# EasyEDA Pro project ProPrj_H750VBT6M2_2025-05-30.epro, schematic Croe
Board Name: Board1; Create Date: 2025-05-16; Page Name: P1; Project Name: H750VBT6M2; Schematic Name: Croe; Update Date: 2025-05-23; Company: 嘉立创EDA; Page Size: A4; Version: V1.0
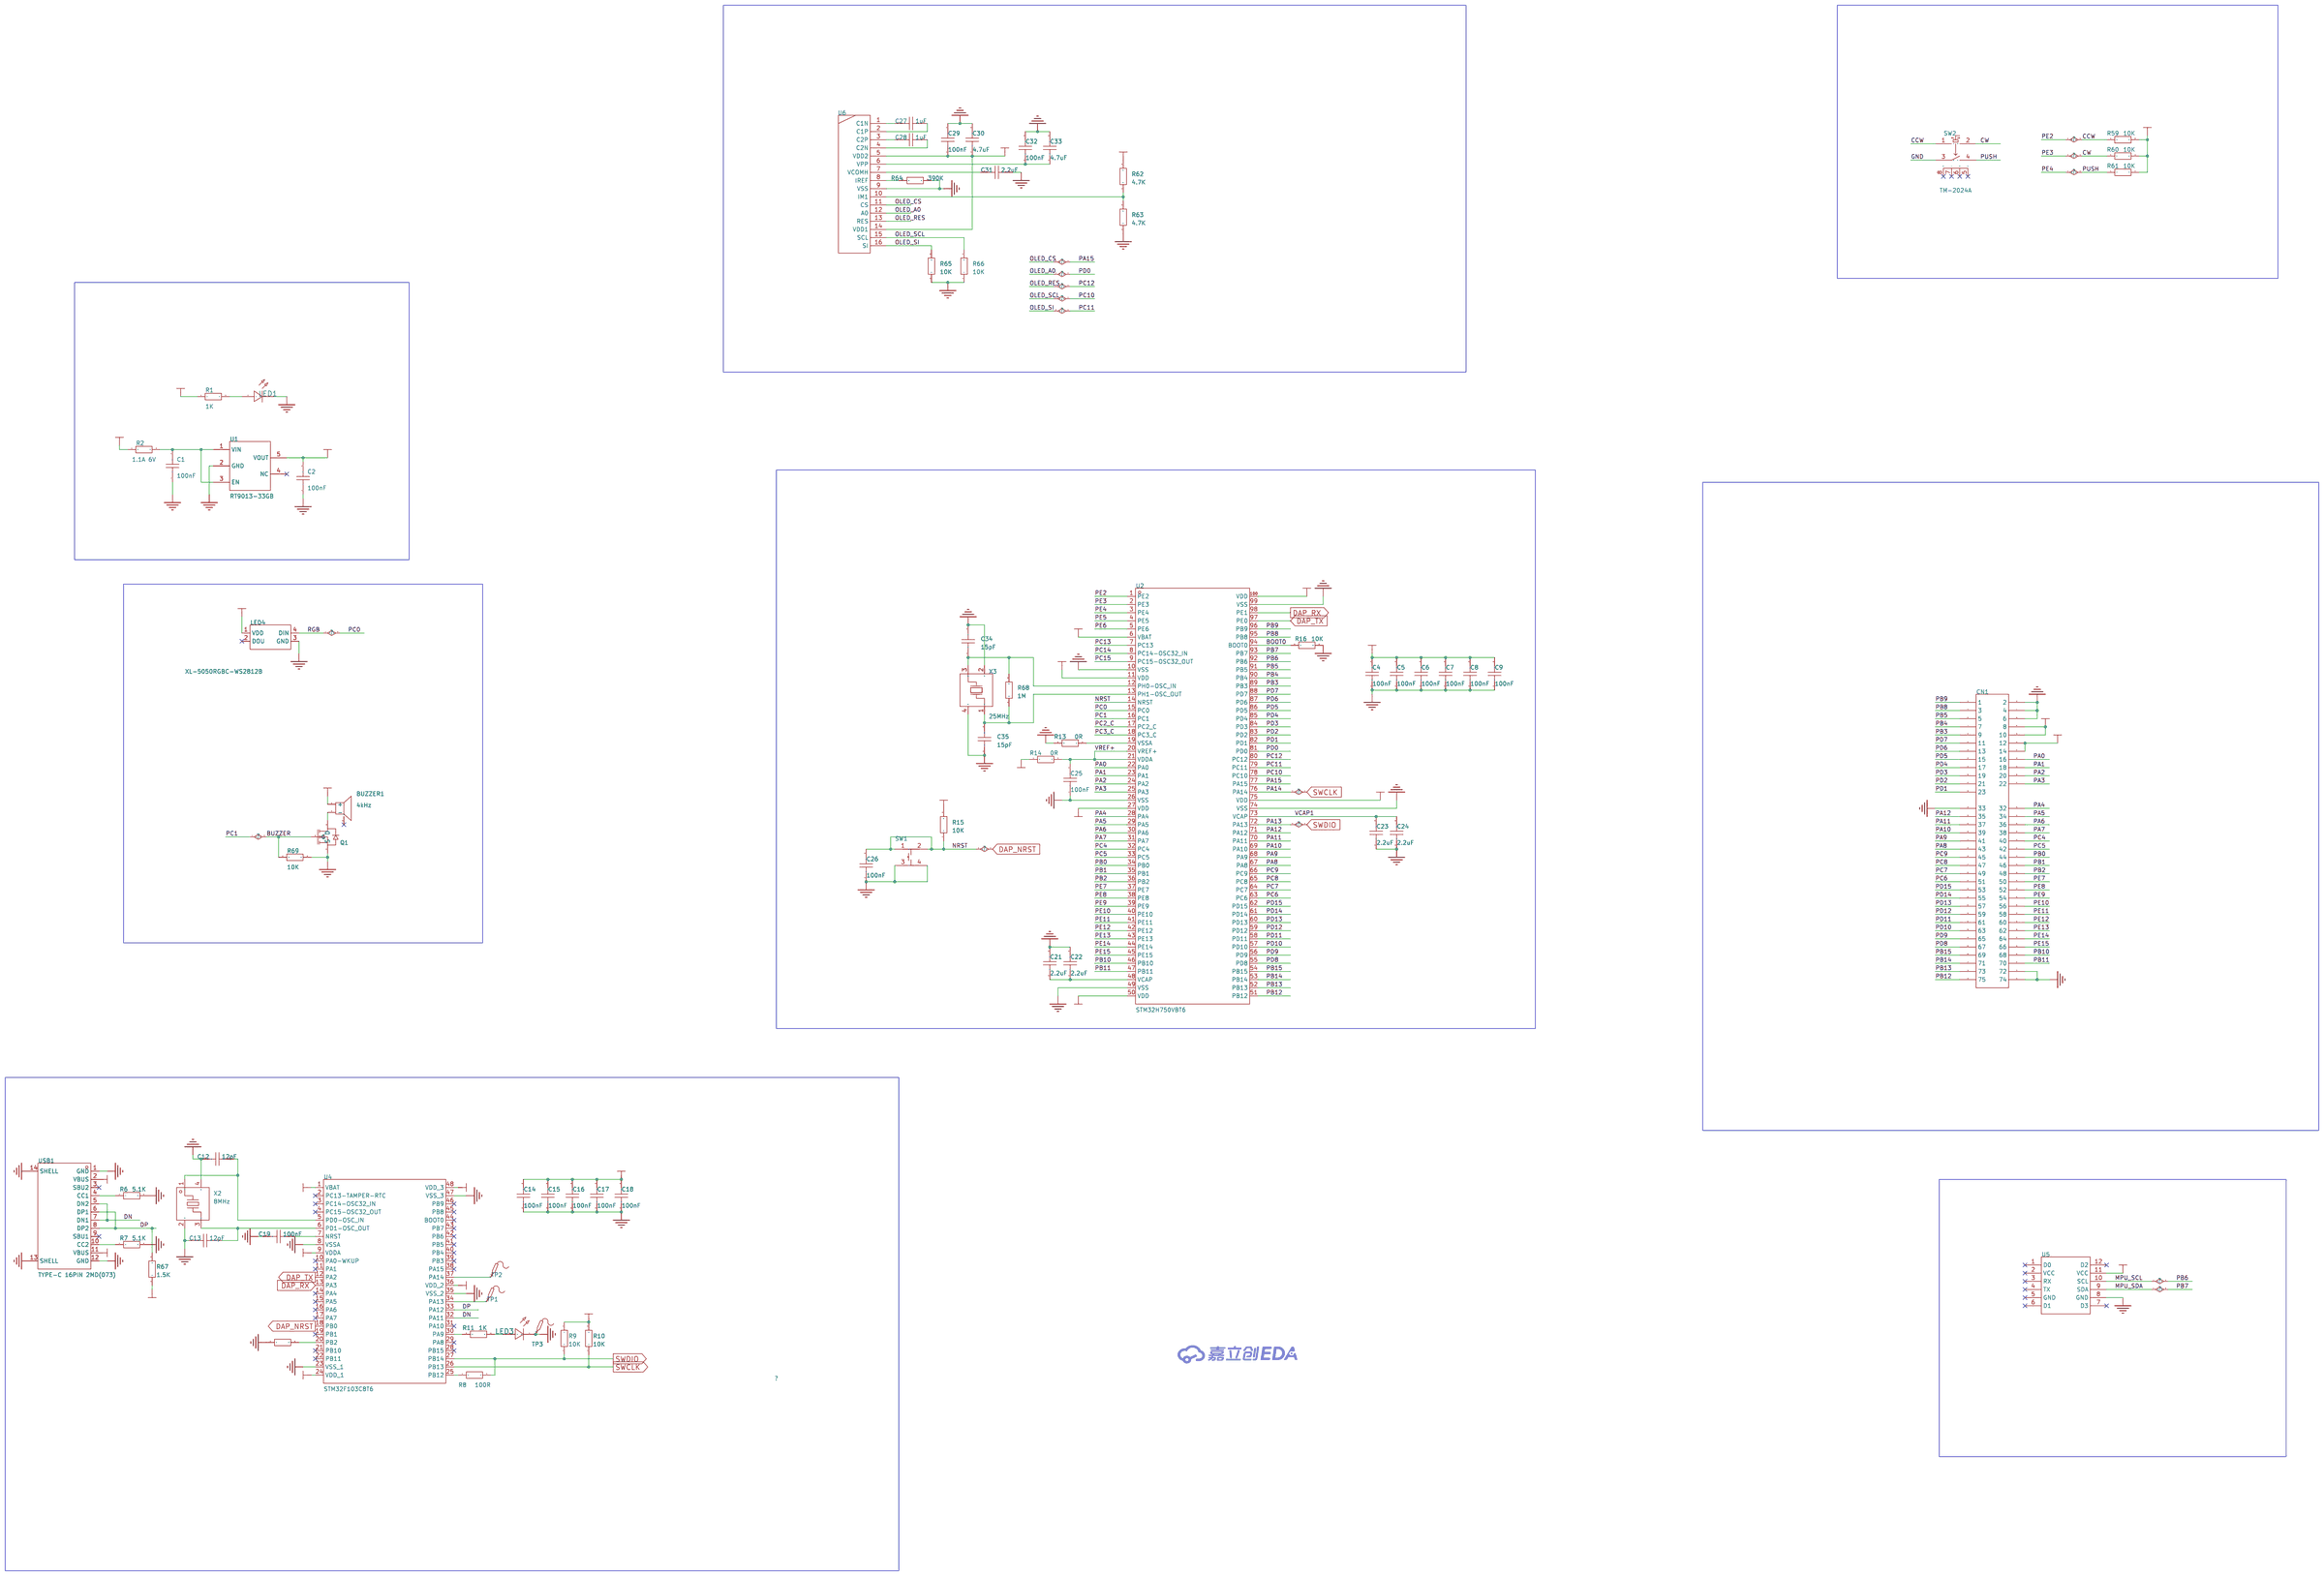
[diagram p1: schematic sheet]

## Parts
BUZZER1  4kHz  [BUZ-SMD_L5.0-W5.5-P4.60]
C1  100nF  [C0603]
C2  100nF  [C0603]
C4  100nF  [C0603]
C5  100nF  [C0603]
C6  100nF  [C0603]
C7  100nF  [C0603]
C8  100nF  [C0603]
C9  100nF  [C0603]
C12  12pF  [C0603]
C13  12pF  [C0603]
C14  100nF  [C0603]
C15  100nF  [C0603]
C16  100nF  [C0603]
C17  100nF  [C0603]
C18  100nF  [C0603]
C19  100nF  [C0603]
C21  2.2uF  [C0603]
C22  2.2uF  [C0603]
C23  2.2uF  [C0603]
C24  2.2uF  [C0603]
C25  100nF  [C0603]
C26  100nF  [C0603]
C27  1uF  [C0603]
C28  1uF  [C0603]
C29  100nF  [C0603]
C30  4.7uF  [C0603]
C31  2.2uF  [C0603]
C32  100nF  [C0603]
C33  4.7uF  [C0603]
C34  15pF  [C0603]
C35  15pF  [C0603]
CN1  M.2-E Key GF  [NGFF-M.2-75P-0.5mmE KEYGF]
LED1  -  [LED_0603]
LED3  -  [LED_0603]
LED4  XL-5050RGBC-WS2812B  [LED-SMD_4P-L5.0-W5.0-BL_XL-5050RGBC]
Q1  -  [SOT-23-3_L2.9-W1.3-P1.90-LS2.4-BR]
R1  1K  [R0603]
R2  1.1A 6V  [R1206]
R6  5.1K  [R0603]
R7  5.1K  [R0603]
R8  100R  [R0603]
R9  10K  [R0603]
R10  10K  [R0603]
R11  1K  [R0603]
R12  10K  [R0603]
R13  0R  [R0603]
R14  0R  [R0603]
R15  10K  [R0603]
R16  10K  [R0603]
R59  10K  [R0603]
R60  10K  [R0603]
R61  10K  [R0603]
R62  4.7K  [R0603]
R63  4.7K  [R0603]
R64  390K  [R0603]
R65  10K  [R0603]
R66  10K  [R0603]
R67  1.5K  [R0603]
R68  1M  [R0603]
R69  10K  [R0603]
SW1  TS3425BA  [SW-SMD_4P-L4.2-W3.2-P2.15-LS4.6-1]
SW2  TM-2024A  [SW-SMD_TM-2024A]
TP1  -  [Test-Point-0.5mm]
TP2  -  [Test-Point-0.5mm]
TP3  -  [Test-Point-0.5mm]
U1  RT9013-33GB  [SOT-23-5_L3.0-W1.7-P0.95-LS2.8-BL]
U2  STM32H750VBT6  [LQFP-100_L14.0-W14.0-P0.50-LS16.0-BL]
U4  STM32F103C8T6  [LQFP-48_L7.0-W7.0-P0.50-LS9.0-BL]
U5  -  [JY901S]
U6  -  [1.29oled_spi_焊接_ch1115]
USB1  TYPE-C 16PIN 2MD(073)  [USB-C-SMD_TYPE-C-6PIN-2MD-073]
X2  8MHz  [CRYSTAL-SMD_4P-L3.2-W2.5-BL]
X3  25MHz  [CRYSTAL-SMD_4P-L3.2-W2.5-BL]

## Library data of the parts
BUZZER1 = MLT-5020: 驱动方式:无源(外部驱动);构造类型:电磁式;频率:4kHz;; Supplier Part: C94598; Manufacturer: 华能; Supplier Footprint: SMD,5x5mm; JLCPCB Part Class: 扩展库; Datasheet: https://atta.szlcsc.com/upload/public/pdf/source/20210811/111454390007D221D7259018FB170E62.pdf; Supplier: LCSC; Driver Circuitry: 无源(外部驱动); Technology: 电磁式; Length: 5.2mm; Width: 5.2mm; Height: 2.5mm
C1 C2 C4-C9 C12-C19 C21-C35 = CAP_0603: Supplier Footprint: 0603
CN1 = M.2-E Key GF: Standardization Check: false; Check: false
LED1 LED3 = LED_0603-R: Supplier Footprint: 0603
LED4 = XL-5050RGBC-WS2812B: 5050七彩幻彩透明贴片LED灯珠 5050 幻彩透明四脚 ws2812B 内置驱动IC; Supplier Part: C2843785; Manufacturer: XINGLIGHT(成兴光); Supplier Footprint: SMD5050; JLCPCB Part Class: 扩展库; Datasheet: https://atta.szlcsc.com/upload/public/pdf/source/20240412/E1004CAA80592E31D08BFE019083806F.pdf; Supplier: LCSC
Q1 = AO3400A_N: 类型:N沟道;漏源电压(Vdss):30V;连续漏极电流(Id):5.2A;功率(Pd):1W;导通电阻(RDS(on)@Vgs,Id):35mΩ@10V,5A;阈值电压(Vgs(th)@Id):1.5V@250μA;; Supplier Footprint: SOT-23; Supplier Part: C700953
R1 R6-R16 R59-R69 = Res_0603: Supplier Footprint: 0603
R2 = Res_1206: Supplier Footprint: 1206
SW1 = TS3425BA: 电路结构:单刀单掷;按钮形状:椭圆形按钮;作用力:250gf;安装方式:立贴;开关长度:4.2mm;开关宽度:3.2mm;开关高度:2.5mm;带支架:不带;触点电流:50mA;额定电压(DC):12V;绝缘电阻:100MΩ;机械寿命:10万次;; LCSC Part Name: 4.2*3.2*2.5mm 立贴 轻触开关; Supplier Part: C2681476; Manufacturer: SHOU HAN(首韩); Supplier Footprint: SMD; JLCPCB Part Class: 扩展库; Datasheet: https://atta.szlcsc.com/upload/public/pdf/source/20210107/C2681476_BF217B2301F0070AA49504CB0BFDE895.pdf; Supplier: LCSC; Circuit: 单刀单掷; Actuator Style: 椭圆形按钮; Operating Force: 250gf; Mounting Style: 立贴; Switch Length: 4.2mm; Switch Width: 3.2mm; Switch Height: 2.5mm; Strike Gundam: 不带; Contact Current: 50mA; Voltage Rating (DC): 12V; Insulation Resistance: 100MΩ; Actuator/Cap Color: 白色; Pin Style: J型引脚; Mechanical Life: 10万次; Operating Temperature: -20℃~+85℃
SW2 = TM-2024A: LCSC Part Name: 四脚两档拨轮开关TM-2024A; Supplier Part: C561480; Manufacturer: XKB Connection(中国星坤); Supplier Footprint: SMD; JLCPCB Part Class: 扩展库; Datasheet: https://atta.szlcsc.com/upload/public/pdf/source/20211011/7A4DB3DC37E7D5823B6D92C66ED3191E.pdf; Supplier: LCSC
TP1-TP3 = Test-Point: Test Point 测试点
U1 = RT9013-33GB: 输出类型:固定;最大输入电压:5.5V;输出电压:3.3V;输出电流:500mA;电源纹波抑制比(PSRR):50dB@(10kHz);输出极性:正极;; LCSC Part Name: 输入5.5V 输出3.3V 500mA; Supplier Part: C47773; Manufacturer: RICHTEK(立锜); Supplier Footprint: SOT-23-5; JLCPCB Part Class: 扩展库; Datasheet: https://atta.szlcsc.com/upload/public/pdf/source/20150504/1457707282459.pdf; Supplier: LCSC; Output Type: 固定; Maximum Input Voltage: 5.5V; Output Voltage: 3.3V; Output Current: 500mA; Power Supply Rejection Ratio (PSRR): 50dB@(10kHz); Dropout Voltage: 400mV@(500mA); standby current: 50uA; Feature: 低ESR；防静电保护；热保护(TSD)；过流保护(OCP)；带使能; Operating Temperature: -40℃~+85℃; Output Polarity: 正极; Number of Outputs: 1
U2 = STM32H750VBT6: CPU内核:ARM-M系列;CPU最大主频:480MHz;应用领域:-;; LCSC Part Name: 带DSP和DP-FPU的高性能ARM Cortex-M7 MCU，具有128 KB Flash、1 MB RAM、480 MHz CPU、一级缓存、外部存储器接口、JPEG编解码器、硬件加密和大量外设; Supplier Part: C404010; Manufacturer: ST(意法半导体); Supplier Footprint: LQFP-100(14x14); JLCPCB Part Class: 扩展库; Datasheet: https://atta.szlcsc.com/upload/public/pdf/source/20231008/912982D4F3BD3DF1AA7D0A7EE6EF5B6B.pdf; Supplier: LCSC; CPU Core: ARM-M系列; CPU Maximum Speed: 480MHz; Program Storage Size: 128KB; Program Memory Type: FLASH; Number of I/O: 82; ADC (Bit): 16bit; DAC (Bit): 12bit; Voltage - Supply: 1.62V~3.6V
U4 = STM32F103C8T6: CPU内核:ARM-M3;程序存储容量:64KB;RAM总容量:20KB;GPIO端口数量:37;工作电压范围:2V~3.6V;CPU最大主频:72MHz;程序存储器类型:FLASH;; Supplier Part: C8734; Manufacturer: ST(意法半导体); Supplier Footprint: LQFP-48(7x7); JLCPCB Part Class: 扩展库; Datasheet: https://atta.szlcsc.com/upload/public/pdf/source/20220812/8363ACEC51AD55ECEB84799464F7CB85.pdf; Supplier: LCSC; CPU Core: ARM-M3; Program Storage Size: 64KB; RAM Size: 20KB; GPIO Ports Number: 37; Operating Voltage Range: 2V~3.6V; CPU Maximum Speed: 72MHz; Program Memory Type: FLASH; Operating Temperature Range: -40℃~+85℃; ADC (Bit): 12bit; Universal Serial Bus: 有; Peripheral/Function: 看门狗；DMA；看门狗；温度传感器; Watchdog: 有; Infrared Data Association: 有; Low-Voltage Detect: 有; Direct Memory Access: 有; Internal Oscillator: 有
U5 = JY901S
U6 = 1.29oled_spi_焊接_ch1115
USB1 = TYPE-C 16PIN 2MD(073): 连接器类型:Type-C;标准:USB 3.1;公母:母;安装方式:卧贴;触点数量:16P;端口数量:1;额定电流 - 电源:5A;工作温度范围:-25℃~+85℃;; LCSC Part Name: Type-C 母 卧贴; Supplier Part: C2765186; Manufacturer: SHOU HAN(首韩); Supplier Footprint: SMD; JLCPCB Part Class: 扩展库; Datasheet: https://atta.szlcsc.com/upload/public/pdf/source/20211123/39B17C16241EAC15C5E277BDA434118E.pdf; Supplier: LCSC; Connector Type: Type-C; Standard: USB 3.1; Gender: 母; Mounting Style: 卧贴; Number of Contacts: 16P; Number of Ports: 1; Current Rating - Power (Max): 5A; Operating Temperature Range: -25℃~+85℃; Rated Voltage (Max): 5V; Connect-Disconnect Life: 5千次; Core Colour: 黑色
X2 = X32258MSB4SI: 晶振类型:贴片晶振;频率:8MHz;常温频差:±10ppm;负载电容:20pF;频率稳定度:±20ppm;; LCSC Part Name: 8MHz ±10ppm 20pF; Supplier Part: C2682774; Manufacturer: YXC(扬兴晶振); Supplier Footprint: SMD3225-4P; JLCPCB Part Class: 扩展库; Datasheet: https://atta.szlcsc.com/upload/public/pdf/source/20240329/19D5F850207469550BEB00D7DFEDBC7A.pdf; Supplier: LCSC; Type: 贴片晶振; Normal temperature Frequency Tolerance: ±10ppm; Load Capacitance: 20pF; Frequency Stability: ±20ppm; Operating Temperature: -40℃~+85℃
X3 = X322525MOB4SI: 晶振类型:贴片晶振;频率:25MHz;常温频差:±10ppm;负载电容:12pF;频率稳定度:±20ppm;; LCSC Part Name: 25MHz ±10ppm 12pF; Supplier Part: C9006; Manufacturer: YXC(扬兴晶振); Supplier Footprint: SMD3225-4P; JLCPCB Part Class: 基础库; Datasheet: https://atta.szlcsc.com/upload/public/pdf/source/20240329/19D5F850207469550BEB00D7DFEDBC7A.pdf; Supplier: LCSC; Type: 贴片晶振; Normal temperature Frequency Tolerance: ±10ppm; Load Capacitance: 12pF; Frequency Stability: ±20ppm; Operating Temperature: -40℃~+85℃

## Nets
3V3: BUZZER1.1(+) C2.2 C4.2 C5.2 C6.2 C7.2 C8.2 C9.2 C14.2 C15.2 C16.2 C17.2 C18.2 C29.1 C30.1 CN1.12 CN1.14 LED4.1(VDD) R1.1 R9.2 R10.2 R14.1 R15.2 R59.2 R60.2 R61.2 R62.2 R67.1 U1.5(VOUT) U2.6(VBAT) U2.11(VDD) U2.27(VDD) U2.50(VDD) U2.75(VDD) U2.100(VDD) U4.1(VBAT) U4.9(VDDA) U4.24(VDD_1) U4.36(VDD_2) U4.48(VDD_3) U5.11(VCC) U6.5(VDD2) U6.14(VDD1)
5V: CN1.8 CN1.10 R2.1 USB1.2(VBUS) USB1.11(VBUS)
GND: C1.1 C2.1 C4.1 C5.1 C6.1 C7.1 C8.1 C9.1 C12.2 C13.1 C14.1 C15.1 C16.1 C17.1 C18.1 C19.1 C21.2 C22.2 C23.1 C24.1 C25.1 C26.1 C29.2 C30.2 C31.2 C32.2 C33.2 C34.2 C35.1 CN1.2 CN1.4 CN1.6 CN1.33 CN1.72 CN1.74 LED1.1(C) LED3.1(C) LED4.3(GND) Q1.2(S) R6.2 R7.2 R12.1 R13.1 R16.2 R63.1 R64.2 R65.1 R66.1 R69.2 SW1.3 SW1.4 SW2.3 TP3.1 U1.2(GND) U2.10(VSS) U2.26(VSS) U2.49(VSS) U2.74(VSS) U2.99(VSS) U4.8(VSSA) U4.23(VSS_1) U4.35(VSS_2) U4.47(VSS_3) U5.8(GND) U6.9(VSS) USB1.1(GND) USB1.12(GND) USB1.13(SHELL) USB1.14(SHELL) X2.2(GND) X2.4(GND) X3.2(GND) X3.4(GND)
BOOT0: R16.1 U2.94(BOOT0)
BUZZER: Q1.1(G) R69.1 U2.16(PC1)
CCW: R59.1 SW2.1 U2.1(PE2)
CW: R60.1 SW2.2 U2.2(PE3)
DAP_NRST: C26.2 R15.1 SW1.1 SW1.2 U2.14(NRST) U4.18(PB0)
DAP_RX: U2.98(PE1) U4.13(PA3)
DAP_TX: U2.97(PE0) U4.12(PA2)
DN: U4.32(PA11) USB1.5(DN2) USB1.7(DN1)
DP: R67.2 U4.33(PA12) USB1.6(DP1) USB1.8(DP2)
MPU_SCL: U2.92(PB6) U5.10(SCL)
MPU_SDA: U2.93(PB7) U5.9(SDA)
OLED_A0: U2.81(PD0) U6.12(A0)
OLED_CS: U2.77(PA15) U6.11(CS)
OLED_RES: U2.80(PC12) U6.13(RES)
OLED_SCL: R66.2 U2.78(PC10) U6.15(SCL)
OLED_SI: R65.2 U2.79(PC11) U6.16(SI)
PA0: CN1.16 U2.22(PA0)
PA1: CN1.18 U2.23(PA1)
PA2: CN1.20 U2.24(PA2)
PA3: CN1.22 U2.25(PA3)
PA4: CN1.32 U2.28(PA4)
PA5: CN1.34 U2.29(PA5)
PA6: CN1.36 U2.30(PA6)
PA7: CN1.38 U2.31(PA7)
PA8: CN1.43 U2.67(PA8)
PA9: CN1.41 U2.68(PA9)
PA10: CN1.39 U2.69(PA10)
PA11: CN1.37 U2.70(PA11)
PA12: CN1.35 U2.71(PA12)
PA13: R8.2 R9.1 U2.72(PA13) U4.27(PB14)
PA14: R10.1 U2.76(PA14) U4.26(PB13)
PB0: CN1.44 U2.34(PB0)
PB1: CN1.46 U2.35(PB1)
PB2: CN1.48 U2.36(PB2)
PB3: CN1.9 U2.89(PB3)
PB4: CN1.7 U2.90(PB4)
PB5: CN1.5 U2.91(PB5)
PB8: CN1.3 U2.95(PB8)
PB9: CN1.1 U2.96(PB9)
PB10: CN1.68 U2.46(PB10)
PB11: CN1.70 U2.47(PB11)
PB12: CN1.75 U2.51(PB12)
PB13: CN1.73 U2.52(PB13)
PB14: CN1.71 U2.53(PB14)
PB15: CN1.69 U2.54(PB15)
PC0: LED4.4(DIN) U2.15(PC0)
PC2_C: U2.17(PC2_C)
PC3_C: U2.18(PC3_C)
PC4: CN1.40 U2.32(PC4)
PC5: CN1.42 U2.33(PC5)
PC6: CN1.51 U2.63(PC6)
PC7: CN1.49 U2.64(PC7)
PC8: CN1.47 U2.65(PC8)
PC9: CN1.45 U2.66(PC9)
PC13: U2.7(PC13)
PC14: U2.8(PC14-OSC32_IN)
PC15: U2.9(PC15-OSC32_OUT)
PD1: CN1.23 U2.82(PD1)
PD2: CN1.21 U2.83(PD2)
PD3: CN1.19 U2.84(PD3)
PD4: CN1.17 U2.85(PD4)
PD5: CN1.15 U2.86(PD5)
PD6: CN1.13 U2.87(PD6)
PD7: CN1.11 U2.88(PD7)
PD8: CN1.67 U2.55(PD8)
PD9: CN1.65 U2.56(PD9)
PD10: CN1.63 U2.57(PD10)
PD11: CN1.61 U2.58(PD11)
PD12: CN1.59 U2.59(PD12)
PD13: CN1.57 U2.60(PD13)
PD14: CN1.55 U2.61(PD14)
PD15: CN1.53 U2.62(PD15)
PE4: R61.1 SW2.4 U2.3(PE4)
PE5: U2.4(PE5)
PE6: U2.5(PE6)
PE7: CN1.50 U2.37(PE7)
PE8: CN1.52 U2.38(PE8)
PE9: CN1.54 U2.39(PE9)
PE10: CN1.56 U2.40(PE10)
PE11: CN1.58 U2.41(PE11)
PE12: CN1.60 U2.42(PE12)
PE13: CN1.62 U2.43(PE13)
PE14: CN1.64 U2.44(PE14)
PE15: CN1.66 U2.45(PE15)
VCAP1: C23.2 C24.2 U2.73(VCAP)
VREF+: C25.2 R14.2 U2.20(VREF+) U2.21(VDDA)
$1N1959: LED1.2(A) R1.2
$1N1960: C1.2 R2.2 U1.1(VIN) U1.3(EN)
$1N3874: R13.2 U2.19(VSSA)
$1N3903: C21.1 C22.1 U2.48(VCAP)
$1N7049: C13.2 U4.6(PD1-OSC_OUT) X2.3
$1N7718: R7.1 USB1.10(CC2)
$1N7761: R6.1 USB1.4(CC1)
$1N7868: TP1.1 U4.34(PA13)
$1N7872: TP2.1 U4.37(PA14)
$1N7979: R8.1 U4.25(PB12)
$1N8280: R11.1 U4.30(PA9)
$1N8284: LED3.2(A) R11.2
$1N8434: R12.2 U4.20(PB2)
$1N8564: C19.2 U4.7(NRST)
$1N12613: C27.2 U6.2(C1P)
$1N12618: C27.1 U6.1(C1N)
$1N12623: C28.2 U6.4(C2N)
$1N12629: C28.1 U6.3(C2P)
$1N12870: R62.1 R63.2 U6.10(IM1)
$1N12999: R64.1 U6.8(IREF)
$1N13129: C32.1 C33.1 U6.6(VPP)
$1N13135: C31.1 U6.7(VCOMH)
$1N13313: C12.1 U4.5(PD0-OSC_IN) X2.1
$1N24000: C34.1 R68.2 U2.12(PH0-OSC_IN) X3.3(OSC2)
$1N24004: C35.2 R68.1 U2.13(PH1-OSC_OUT) X3.1(OSC1)
$1N24569: BUZZER1.2(-) Q1.3(D)

Not connected (* = marked no-connect by the designer): BUZZER1 3(NC)*; LED4 2(DOU)*; SW2 5* 6* 7* 8*; U1 4(NC)*; U4 2(PC13-TAMPER-RTC)* 3(PC14-OSC32_IN)* 4(PC15-OSC32_OUT)* 10(PA0-WKUP)* 11(PA1)* 14(PA4)* 15(PA5)* 16(PA6)* 17(PA7)* 19(PB1)* 21(PB10)* 22(PB11)* 28(PB15)* 29(PA8)* 31(PA10)* 38(PA15)* 39(PB3)* 40(PB4)* 41(PB5)* 42(PB6)* 43(PB7)* 44(BOOT0)* 45(PB8)* 46(PB9)*; U5 1(D0)* 2(VCC)* 3(RX)* 4(TX)* 5(GND)* 6(D1)* 7(D3)* 12(D2)*; USB1 3(SBU2)* 9(SBU1)*
